# EasyEDA Pro project velocity_keyboard_board.eprj

# Schematic Schematic1
Board Name: Board1; Create Date: 2026-10-10; Page Name: P1; Project Name: DDswitch; Schematic Name: Schematic1; Update Date: 2026-10-10; Company: 嘉立创EDA; Page Size: A4; Version: V1.0
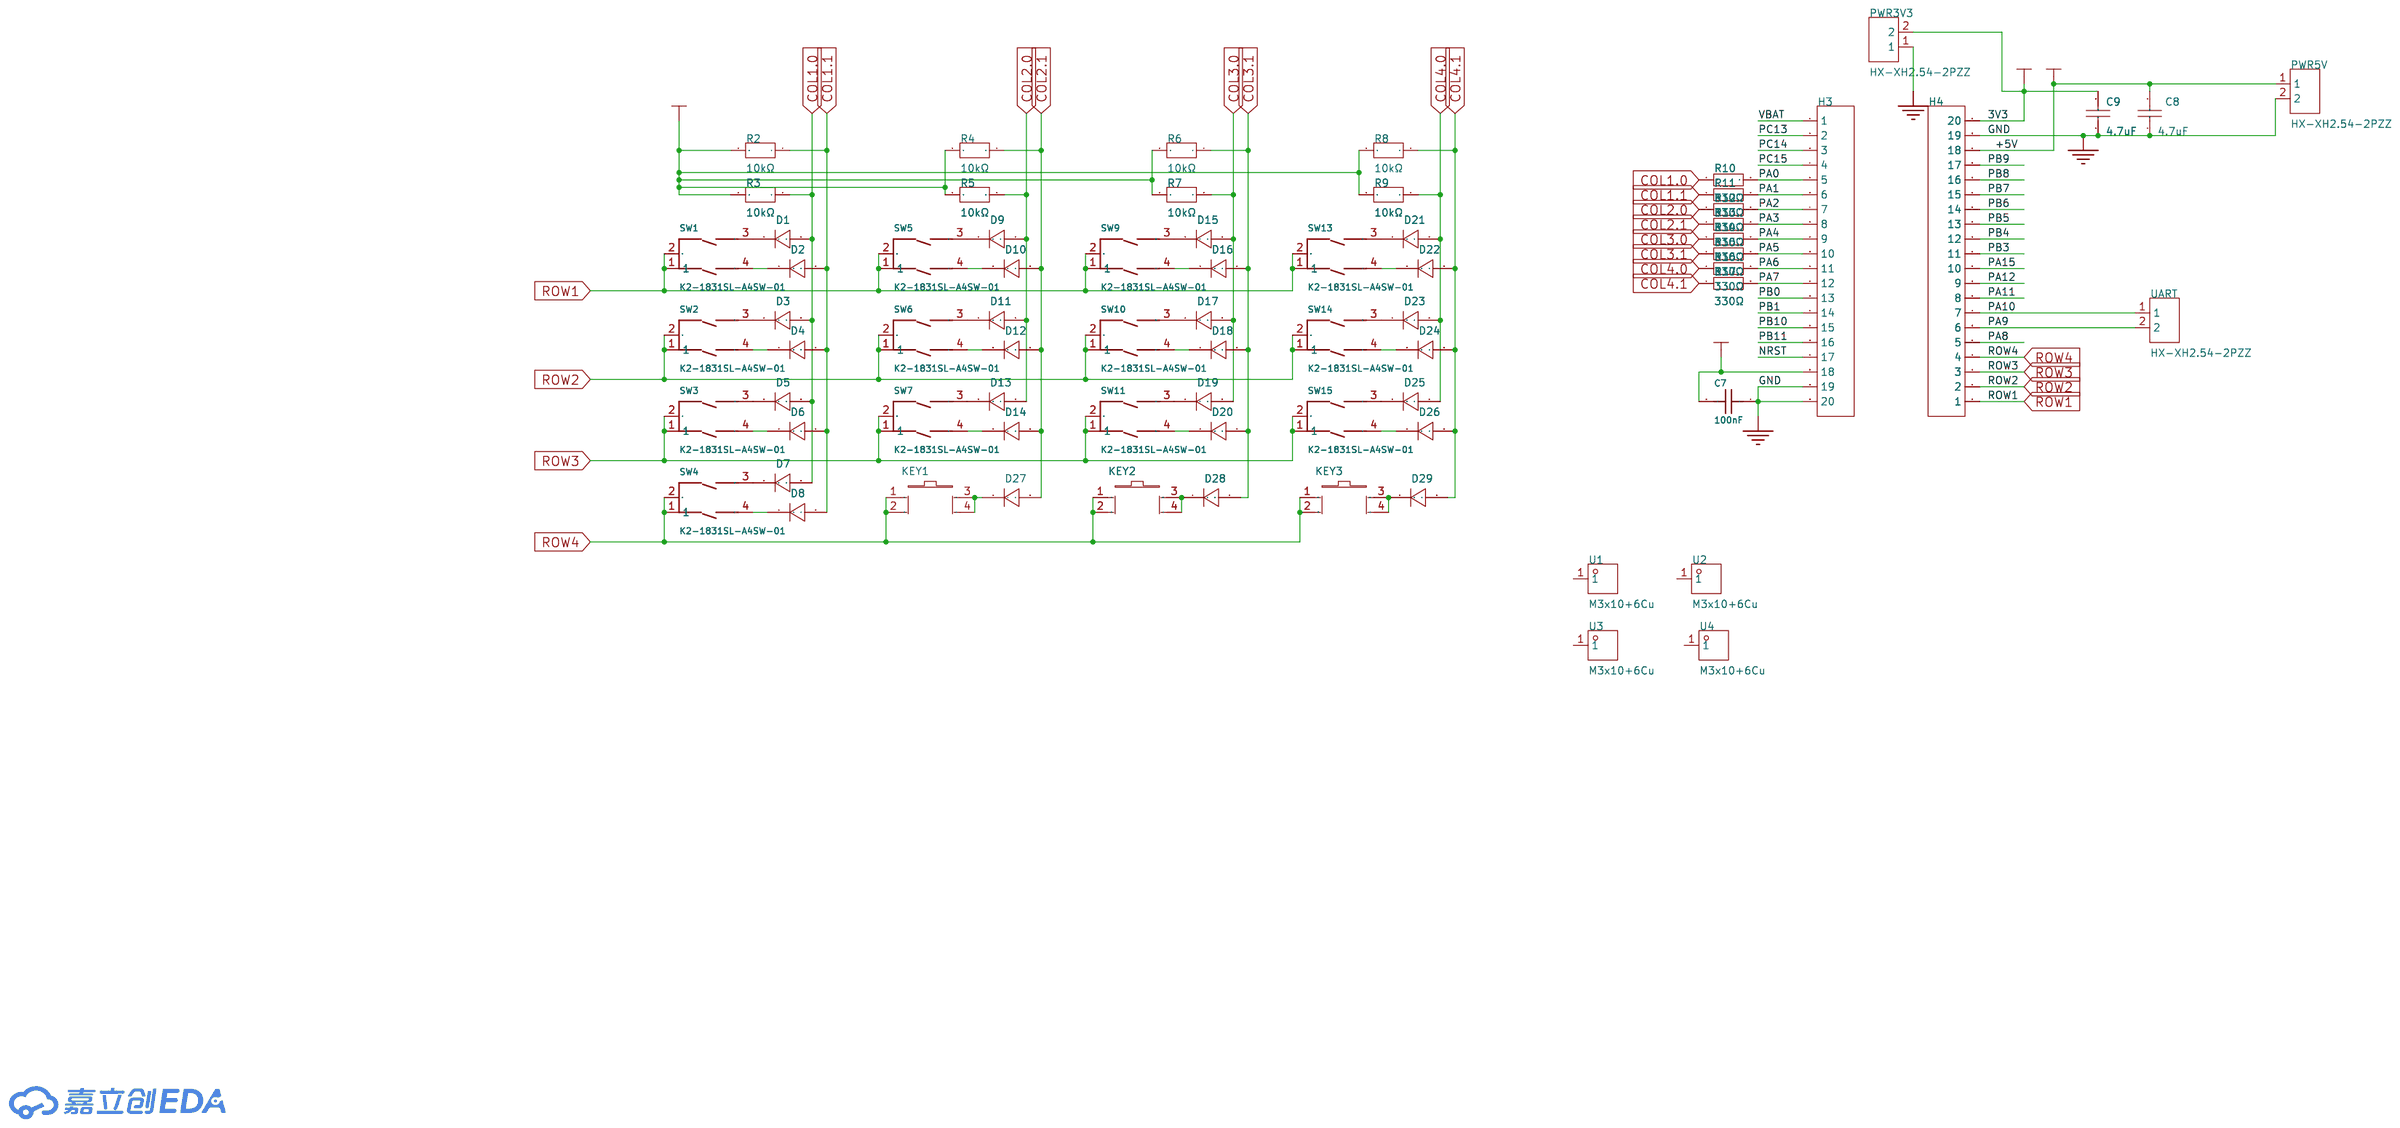
[diagram p0: schematic sheet]

## Parts
C7  100nF  [C0603]
C8  4.7uF  [C0805]
C9  4.7uF  [C0805]
D1  1N4148W  [SOD-123F_L2.7-W1.6-LS3.8-RD]
D2  1N4148W  [SOD-123F_L2.7-W1.6-LS3.8-RD]
D3  1N4148W  [SOD-123F_L2.7-W1.6-LS3.8-RD]
D4  1N4148W  [SOD-123F_L2.7-W1.6-LS3.8-RD]
D5  1N4148W  [SOD-123F_L2.7-W1.6-LS3.8-RD]
D6  1N4148W  [SOD-123F_L2.7-W1.6-LS3.8-RD]
D7  1N4148W  [SOD-123F_L2.7-W1.6-LS3.8-RD]
D8  1N4148W  [SOD-123F_L2.7-W1.6-LS3.8-RD]
D9  1N4148W  [SOD-123F_L2.7-W1.6-LS3.8-RD]
D10  1N4148W  [SOD-123F_L2.7-W1.6-LS3.8-RD]
D11  1N4148W  [SOD-123F_L2.7-W1.6-LS3.8-RD]
D12  1N4148W  [SOD-123F_L2.7-W1.6-LS3.8-RD]
D13  1N4148W  [SOD-123F_L2.7-W1.6-LS3.8-RD]
D14  1N4148W  [SOD-123F_L2.7-W1.6-LS3.8-RD]
D15  1N4148W  [SOD-123F_L2.7-W1.6-LS3.8-RD]
D16  1N4148W  [SOD-123F_L2.7-W1.6-LS3.8-RD]
D17  1N4148W  [SOD-123F_L2.7-W1.6-LS3.8-RD]
D18  1N4148W  [SOD-123F_L2.7-W1.6-LS3.8-RD]
D19  1N4148W  [SOD-123F_L2.7-W1.6-LS3.8-RD]
D20  1N4148W  [SOD-123F_L2.7-W1.6-LS3.8-RD]
D21  1N4148W  [SOD-123F_L2.7-W1.6-LS3.8-RD]
D22  1N4148W  [SOD-123F_L2.7-W1.6-LS3.8-RD]
D23  1N4148W  [SOD-123F_L2.7-W1.6-LS3.8-RD]
D24  1N4148W  [SOD-123F_L2.7-W1.6-LS3.8-RD]
D25  1N4148W  [SOD-123F_L2.7-W1.6-LS3.8-RD]
D26  1N4148W  [SOD-123F_L2.7-W1.6-LS3.8-RD]
D27  1N4148W  [SOD-123F_L2.7-W1.6-LS3.8-RD]
D28  1N4148W  [SOD-123F_L2.7-W1.6-LS3.8-RD]
D29  1N4148W  [SOD-123F_L2.7-W1.6-LS3.8-RD]
H3  -  [HDR-TH_20P-P2.54-V-F]
H4  -  [HDR-TH_20P-P2.54-V-F]
KEY1  轻触开关12x12x9直插  [KEY-TH_4P-L12.0-W12.0-P5.00-LS12.5]
KEY2  轻触开关12x12x9直插  [KEY-TH_4P-L12.0-W12.0-P5.00-LS12.5]
KEY3  轻触开关12x12x9直插  [KEY-TH_4P-L12.0-W12.0-P5.00-LS12.5]
PWR3V3  HX-XH2.54-2PZZ  [CONN-TH_2P-P2.50_HX-2.54MM-2P-ZZ-MS]
PWR5V  HX-XH2.54-2PZZ  [CONN-TH_2P-P2.50_HX-2.54MM-2P-ZZ-MS]
R2  10kΩ  [R0805]
R3  10kΩ  [R0805]
R4  10kΩ  [R0805]
R5  10kΩ  [R0805]
R6  10kΩ  [R0805]
R7  10kΩ  [R0805]
R8  10kΩ  [R0805]
R9  10kΩ  [R0805]
R10  330Ω  [R0805]
R11  330Ω  [R0805]
R12  330Ω  [R0805]
R13  330Ω  [R0805]
R14  330Ω  [R0805]
R15  330Ω  [R0805]
R16  330Ω  [R0805]
R17  330Ω  [R0805]
SW1  K2-1831SL-A4SW-01  [SW-SMD_4P-L6.5-W6.2-P4.50-LS8.4-TL-EH]
SW2  K2-1831SL-A4SW-01  [SW-SMD_4P-L6.5-W6.2-P4.50-LS8.4-TL-EH]
SW3  K2-1831SL-A4SW-01  [SW-SMD_4P-L6.5-W6.2-P4.50-LS8.4-TL-EH]
SW4  K2-1831SL-A4SW-01  [SW-SMD_4P-L6.5-W6.2-P4.50-LS8.4-TL-EH]
SW5  K2-1831SL-A4SW-01  [SW-SMD_4P-L6.5-W6.2-P4.50-LS8.4-TL-EH]
SW6  K2-1831SL-A4SW-01  [SW-SMD_4P-L6.5-W6.2-P4.50-LS8.4-TL-EH]
SW7  K2-1831SL-A4SW-01  [SW-SMD_4P-L6.5-W6.2-P4.50-LS8.4-TL-EH]
SW9  K2-1831SL-A4SW-01  [SW-SMD_4P-L6.5-W6.2-P4.50-LS8.4-TL-EH]
SW10  K2-1831SL-A4SW-01  [SW-SMD_4P-L6.5-W6.2-P4.50-LS8.4-TL-EH]
SW11  K2-1831SL-A4SW-01  [SW-SMD_4P-L6.5-W6.2-P4.50-LS8.4-TL-EH]
SW13  K2-1831SL-A4SW-01  [SW-SMD_4P-L6.5-W6.2-P4.50-LS8.4-TL-EH]
SW14  K2-1831SL-A4SW-01  [SW-SMD_4P-L6.5-W6.2-P4.50-LS8.4-TL-EH]
SW15  K2-1831SL-A4SW-01  [SW-SMD_4P-L6.5-W6.2-P4.50-LS8.4-TL-EH]
U1  M3x10+6Cu  [SMD_L4.7-W4.7-D3.0]
U2  M3x10+6Cu  [SMD_L4.7-W4.7-D3.0]
U3  M3x10+6Cu  [SMD_L4.7-W4.7-D3.0]
U4  M3x10+6Cu  [SMD_L4.7-W4.7-D3.0]
UART  HX-XH2.54-2PZZ  [CONN-TH_2P-P2.50_HX-2.54MM-2P-ZZ-MS]

## Library data of the parts
C7 = CC0603KRX7R9BB104: 容值:100nF;精度:±10%;额定电压:50V;温度系数:X7R;; LCSC Part Name: 100nF ±10% 50V; Supplier Part: C14663; Manufacturer: YAGEO(国巨); Supplier Footprint: 0603; JLCPCB Part Class: 基础库; Datasheet: https://item.szlcsc.com/datasheet/CC0603KRX7R9BB104/15331.html; Supplier: LCSC; Tolerance: ±10%; Voltage Rating: 50V; Temperature Coefficient: X7R
C8 C9 = CL21A475KAQNNNE: 容值:4.7uF;精度:±10%;额定电压:25V;温度系数:X5R;; LCSC Part Name: 4.7uF ±10% 25V; Supplier Part: C1779; Manufacturer: SAMSUNG(三星); Supplier Footprint: 0805; JLCPCB Part Class: 基础库; Datasheet: https://item.szlcsc.com/datasheet/CL21A475KAQNNNE/2131.html; Supplier: LCSC; Tolerance: ±10%; Voltage Rating: 25V; Temperature Coefficient: X5R
D1-D29 = 1N4148W_C81598: 二极管配置:独立式;整流电流:150mA;直流反向耐压(Vr):75V;正向压降(Vf):1V@50mA;反向恢复时间(Trr):4ns;; LCSC Part Name: 75V 150mA; Supplier Part: C81598; Manufacturer: ST(先科); Supplier Footprint: SOD-123; JLCPCB Part Class: 基础库; Datasheet: https://item.szlcsc.com/datasheet/1N4148W/82750.html; Supplier: LCSC; Diode Configuration: 独立式; Pd - Power Dissipation: 400mW; Current - Rectified: 150mA; Voltage - DC Reverse(Vr): 75V; Voltage - Forward(Vf@If): 1V@50mA; Non-Repetitive Peak Forward Surge Current: 1A; Reverse Leakage Current (Ir): 1uA@75V; Reverse Recovery Time (trr): 4ns
H3 H4 = HDR-F_2.54_1x20P: Supplier Part: C50984; Supplier Footprint: 插件; JLCPCB Part Class: 扩展库
KEY1-KEY3 = 轻触开关12x12x9直插: 塑料头; LCSC Part Name: 12x12x9; Supplier Part: C27371; Supplier Footprint: 插件; JLCPCB Part Class: 扩展库; Supplier: LCSC
PWR3V3 PWR5V UART = HX-XH2.54-2PZZ: 插针结构:1x2P;间距:2.54mm;安装方式:直插;参考系列:XH;总PIN数:2P;排数:1;每排PIN数:2;行距:-;额定电流:3A;触头材质:黄铜;触头镀层:锡;工作温度:-25℃~+85℃;; LCSC Part Name: 1x2P 间距:2.54mm 直插 系列:XH; Supplier Part: C42391660; Manufacturer: hanxia(韩下); Supplier Footprint: 插件,P=2.54mm; JLCPCB Part Class: 扩展库; Datasheet: https://item.szlcsc.com/datasheet/HX-XH2.54-2PZZ/44326932.html; Supplier: LCSC; Pins Structure: 1x2P; Pitch: 2.54mm; Mounting Type: 直插; Reference Series: XH; Number of Pins: 2P; Number of Rows: 1; Number of PINs Per Row: 2; Current Rating: 3A; Contact Material: 黄铜; Contact Plating: 锡; Operating Temperature: -25℃~+85℃; Voltage Rating: 250V; Plastic Material: PA66; Flame Retardant Rating: UL94V-0; Color: 白色
R2-R9 = FRC0805F1002TS: LCSC Part Name: 10kΩ ±1% 125mW 厚膜电阻; Supplier Part: C2907219; Manufacturer: FOJAN(富捷); Supplier Footprint: 0805; JLCPCB Part Class: 扩展库; Supplier: LCSC; Type: 厚膜电阻; Tolerance: ±1%; Power(Watts): 125mW; Voltage-Supply(Max): 150V; Temperature Coefficient: ±100ppm/℃; Operating Temperature: -55℃~+155℃
R10-R17 = 0805W8F3300T5E: LCSC Part Name: 厚膜电阻 330Ω ±1%; Supplier Part: C17630; Manufacturer: UNI-ROYAL(厚声); Supplier Footprint: 0805; JLCPCB Part Class: 基础库; Datasheet: https://item.szlcsc.com/datasheet/0805W8F3300T5E/18318.html; Supplier: LCSC; Type: 厚膜电阻; Tolerance: ±1%; Power(Watts): 125mW; Voltage-Supply(Max): 150V; Temperature Coefficient: ±100ppm/℃; Operating Temperature: -55℃~+155℃
SW1-SW7 SW9-SW11 SW13-SW15 = K2-1831SL-A4SW-01: LCSC Part Name: 6.2mm×6.5mm 两段式 4P贴片轻触开关; Supplier Part: C38535756; Manufacturer: 韩国韩荣; Supplier Footprint: SMD-4P,6.5x6.2mm; JLCPCB Part Class: 扩展库; Datasheet: https://item.szlcsc.com/datasheet/K2-1831SL-A4SW-01/40261745.html; Supplier: LCSC
U1-U4 = M3x10+6Cu: M3x10+6; LCSC Part Name: Shuntian(顺天五金) 单头六角隔离铜柱螺柱 M3X10+6 国标 黄铜 袋装; Supplier Part: C551322; Manufacturer: Shuntian(顺天五金); JLCPCB Part Class: 扩展库; Datasheet: https://item.szlcsc.com/datasheet/M3x10%252B6Cu/575012.html; Supplier: LCSC

## Nets
3V3: C7.2 C9.2 H3.18 H4.20 PWR3V3.2 R2.2 R3.2 R4.2 R5.2 R6.2 R7.2 R8.2 R9.2
+5V: C8.2 H4.18 PWR5V.1
GND: C7.1 C8.1 C9.1 H3.19 H3.20 H4.19 PWR3V3.1 PWR5V.2
VBAT: H3.1
COL1.0: D1.2(A) D3.2(A) D5.2(A) D7.2(A) R3.1 R10.1
COL1.1: D2.2(A) D4.2(A) D6.2(A) D8.2(A) R2.1 R11.1
COL2.0: D9.2(A) D11.2(A) D13.2(A) R5.1 R12.1
COL2.1: D10.2(A) D12.2(A) D14.2(A) D27.2(A) R4.1 R13.1
COL3.0: D15.2(A) D17.2(A) D19.2(A) R7.1 R14.1
COL3.1: D16.2(A) D18.2(A) D20.2(A) D28.2(A) R6.1 R15.1
COL4.0: D21.2(A) D23.2(A) D25.2(A) R9.1 R16.1
COL4.1: D22.2(A) D24.2(A) D26.2(A) D29.2(A) R8.1 R17.1
NRST: H3.17
PA0: H3.5 R10.2
PA1: H3.6 R11.2
PA2: H3.7 R12.2
PA3: H3.8 R13.2
PA4: H3.9 R14.2
PA5: H3.10 R15.2
PA6: H3.11 R16.2
PA7: H3.12 R17.2
PA8: H4.5
PA9: H4.6 UART.2
PA10: H4.7 UART.1
PA11: H4.8
PA12: H4.9
PA15: H4.10
PB0: H3.13
PB1: H3.14
PB3: H4.11
PB4: H4.12
PB5: H4.13
PB6: H4.14
PB7: H4.15
PB8: H4.16
PB9: H4.17
PB10: H3.15
PB11: H3.16
PC13: H3.2
PC14: H3.3
PC15: H3.4
ROW1: H4.1 SW1.1 SW1.2(C) SW5.1 SW5.2(C) SW9.1 SW9.2(C) SW13.1 SW13.2(C)
ROW2: H4.2 SW2.1 SW2.2(C) SW6.1 SW6.2(C) SW10.1 SW10.2(C) SW14.1 SW14.2(C)
ROW3: H4.3 SW3.1 SW3.2(C) SW7.1 SW7.2(C) SW11.1 SW11.2(C) SW15.1 SW15.2(C)
ROW4: H4.4 KEY1.1 KEY1.2 KEY2.1 KEY2.2 KEY3.1 KEY3.2 SW4.1 SW4.2(C)
$1N820: D2.1(K) SW1.4
$1N986: D6.1(K) SW3.4
$1N1068: D8.1(K) SW4.4
$1N1150: D10.1(K) SW5.4
$1N1314: D14.1(K) SW7.4
$1N1396: D16.1(K) SW9.4
$1N1560: D20.1(K) SW11.4
$1N1642: D22.1(K) SW13.4
$1N1724: D24.1(K) SW14.4
$1N1806: D26.1(K) SW15.4
$1N1847: D27.1(K) KEY1.3 KEY1.4
$1N1888: D28.1(K) KEY2.3 KEY2.4
$1N2696: D1.1(K) SW1.3
$1N2698: D9.1(K) SW5.3
$1N2700: D15.1(K) SW9.3
$1N2702: D21.1(K) SW13.3
$1N2704: D23.1(K) SW14.3
$1N2706: D25.1(K) SW15.3
$1N2708: D19.1(K) SW11.3
$1N2710: D17.1(K) SW10.3
$1N2712: D11.1(K) SW6.3
$1N2718: D13.1(K) SW7.3
$1N2720: D5.1(K) SW3.3
$1N2722: D7.1(K) SW4.3
$1N2969: D3.1(K) SW2.3
$1N3135: D12.1(K) SW6.4
$1N3179: D4.1(K) SW2.4
$1N3328: D18.1(K) SW10.4
$1N6597: D29.1(K) KEY3.3 KEY3.4

Not connected (* = marked no-connect by the designer): U1 1; U2 1; U3 1; U4 1

# Board PCB1
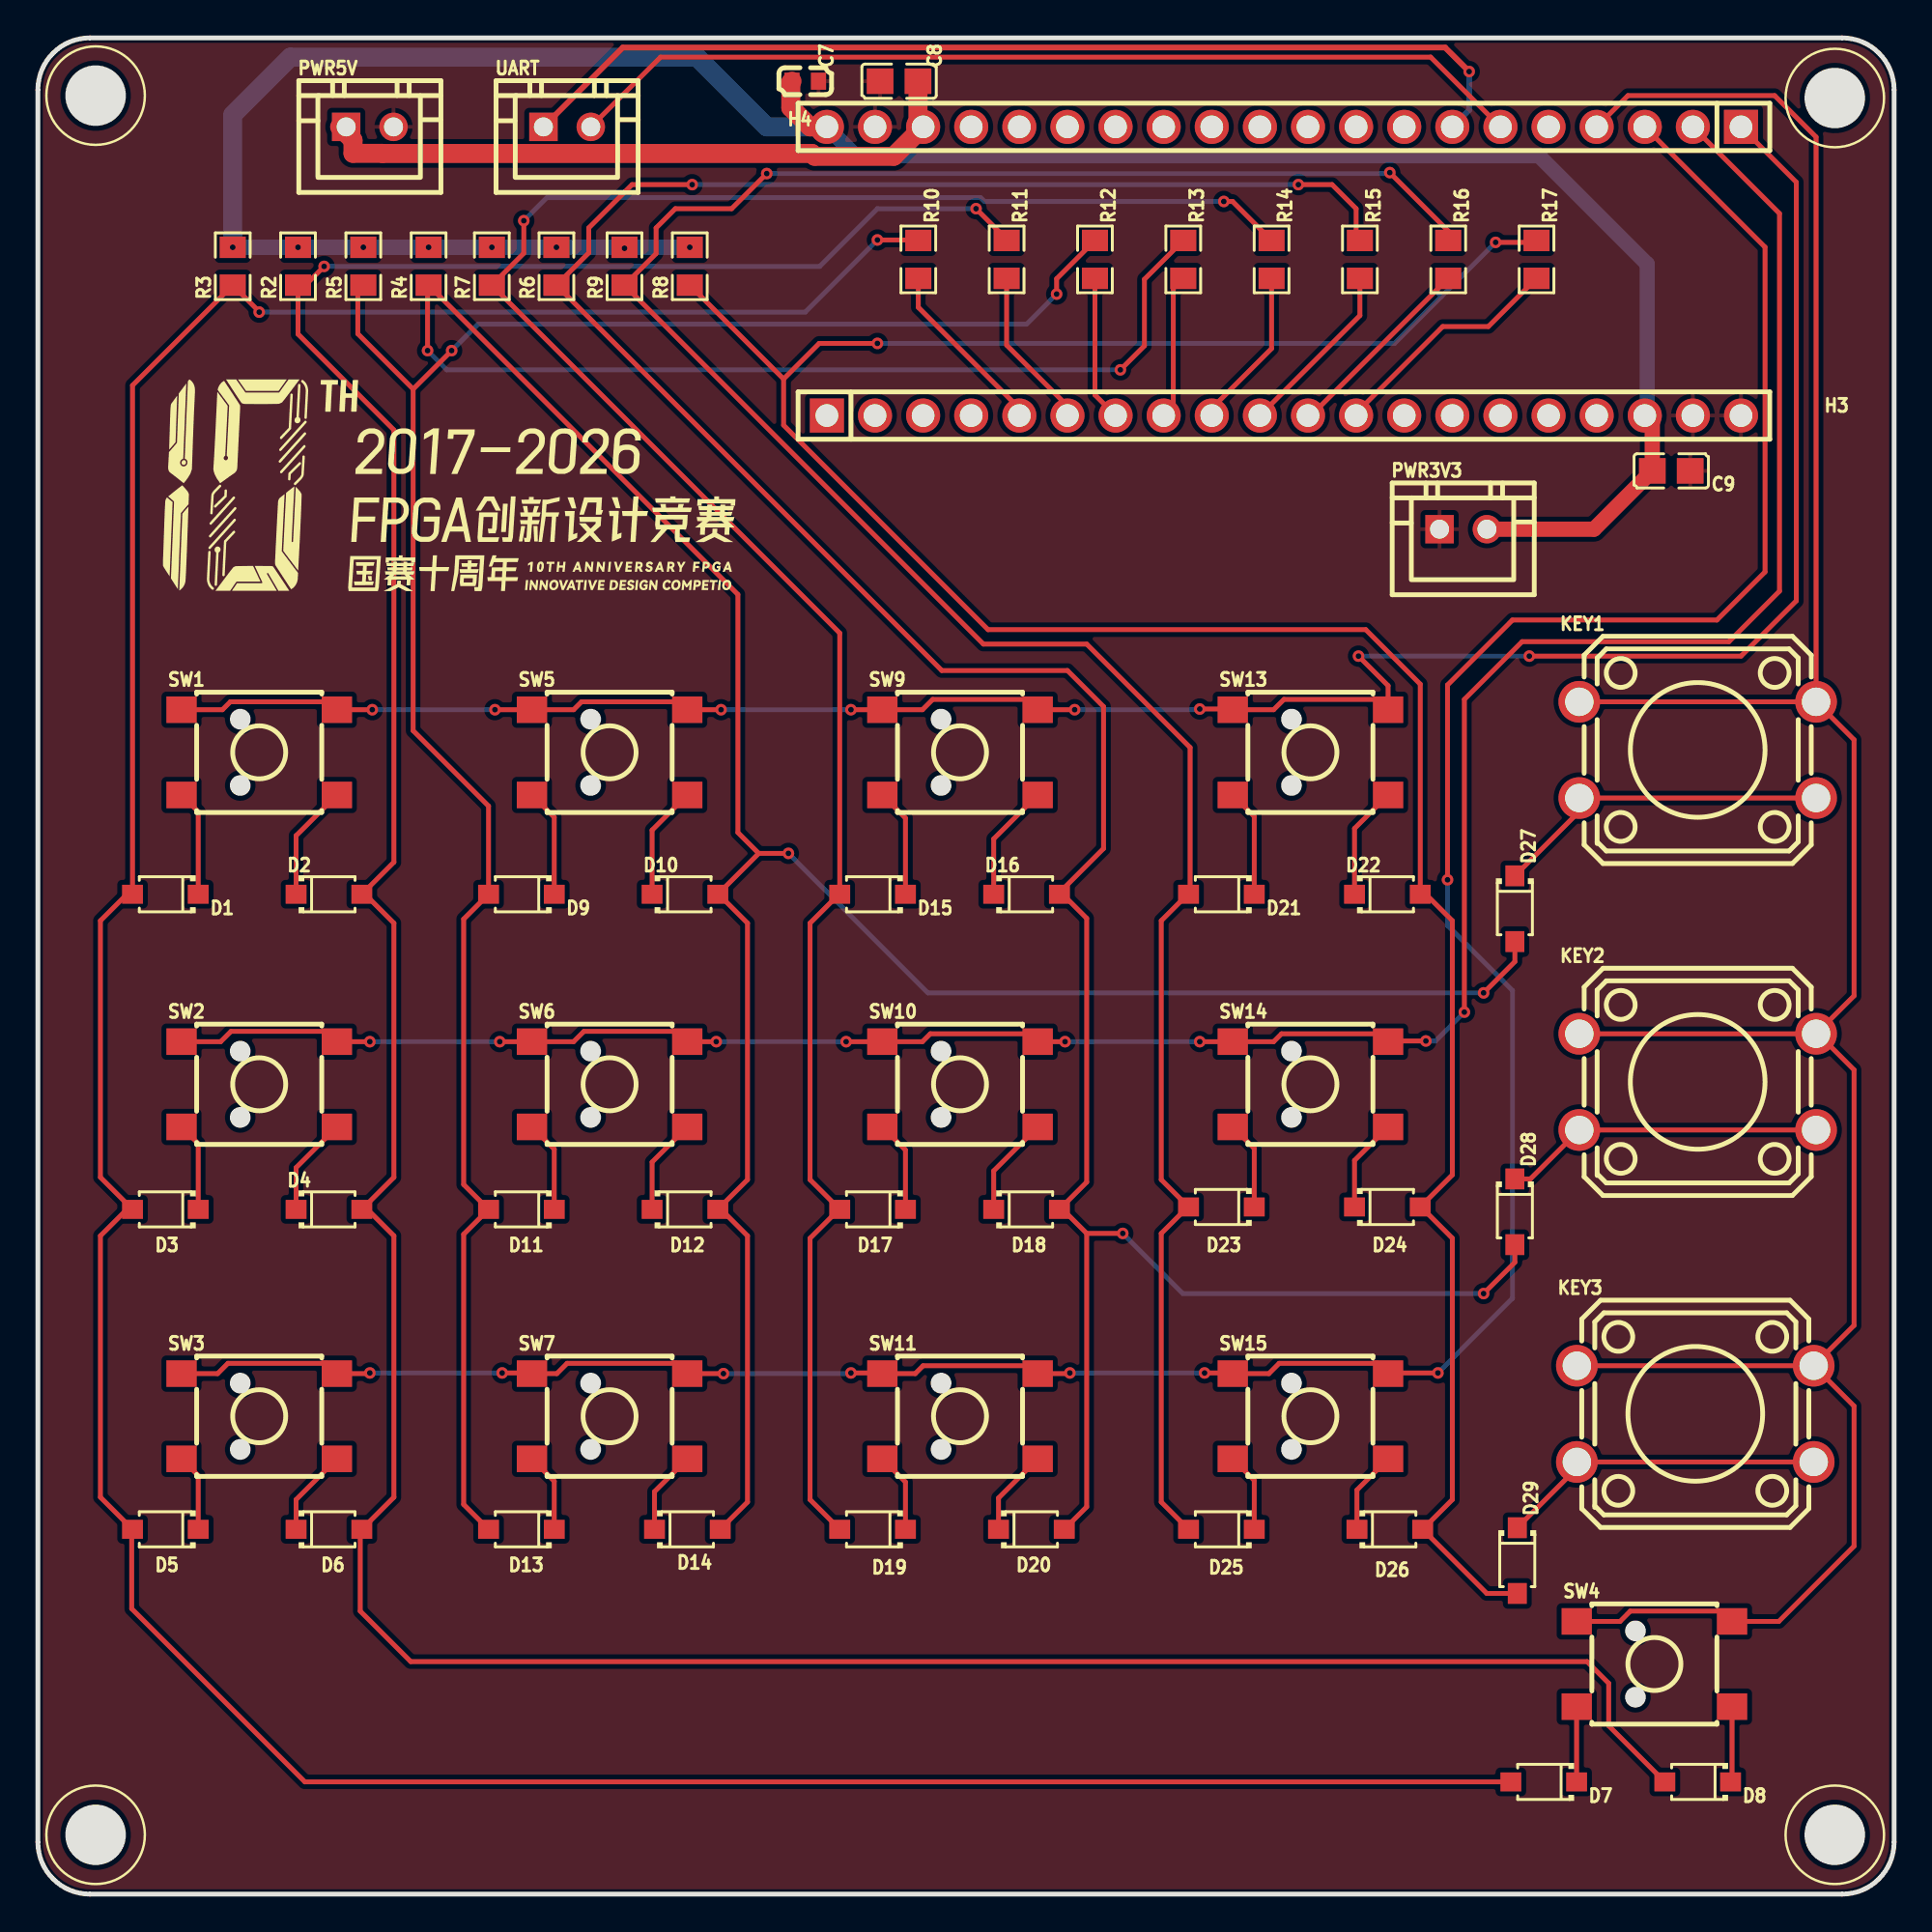
[diagram p1: board, top side]
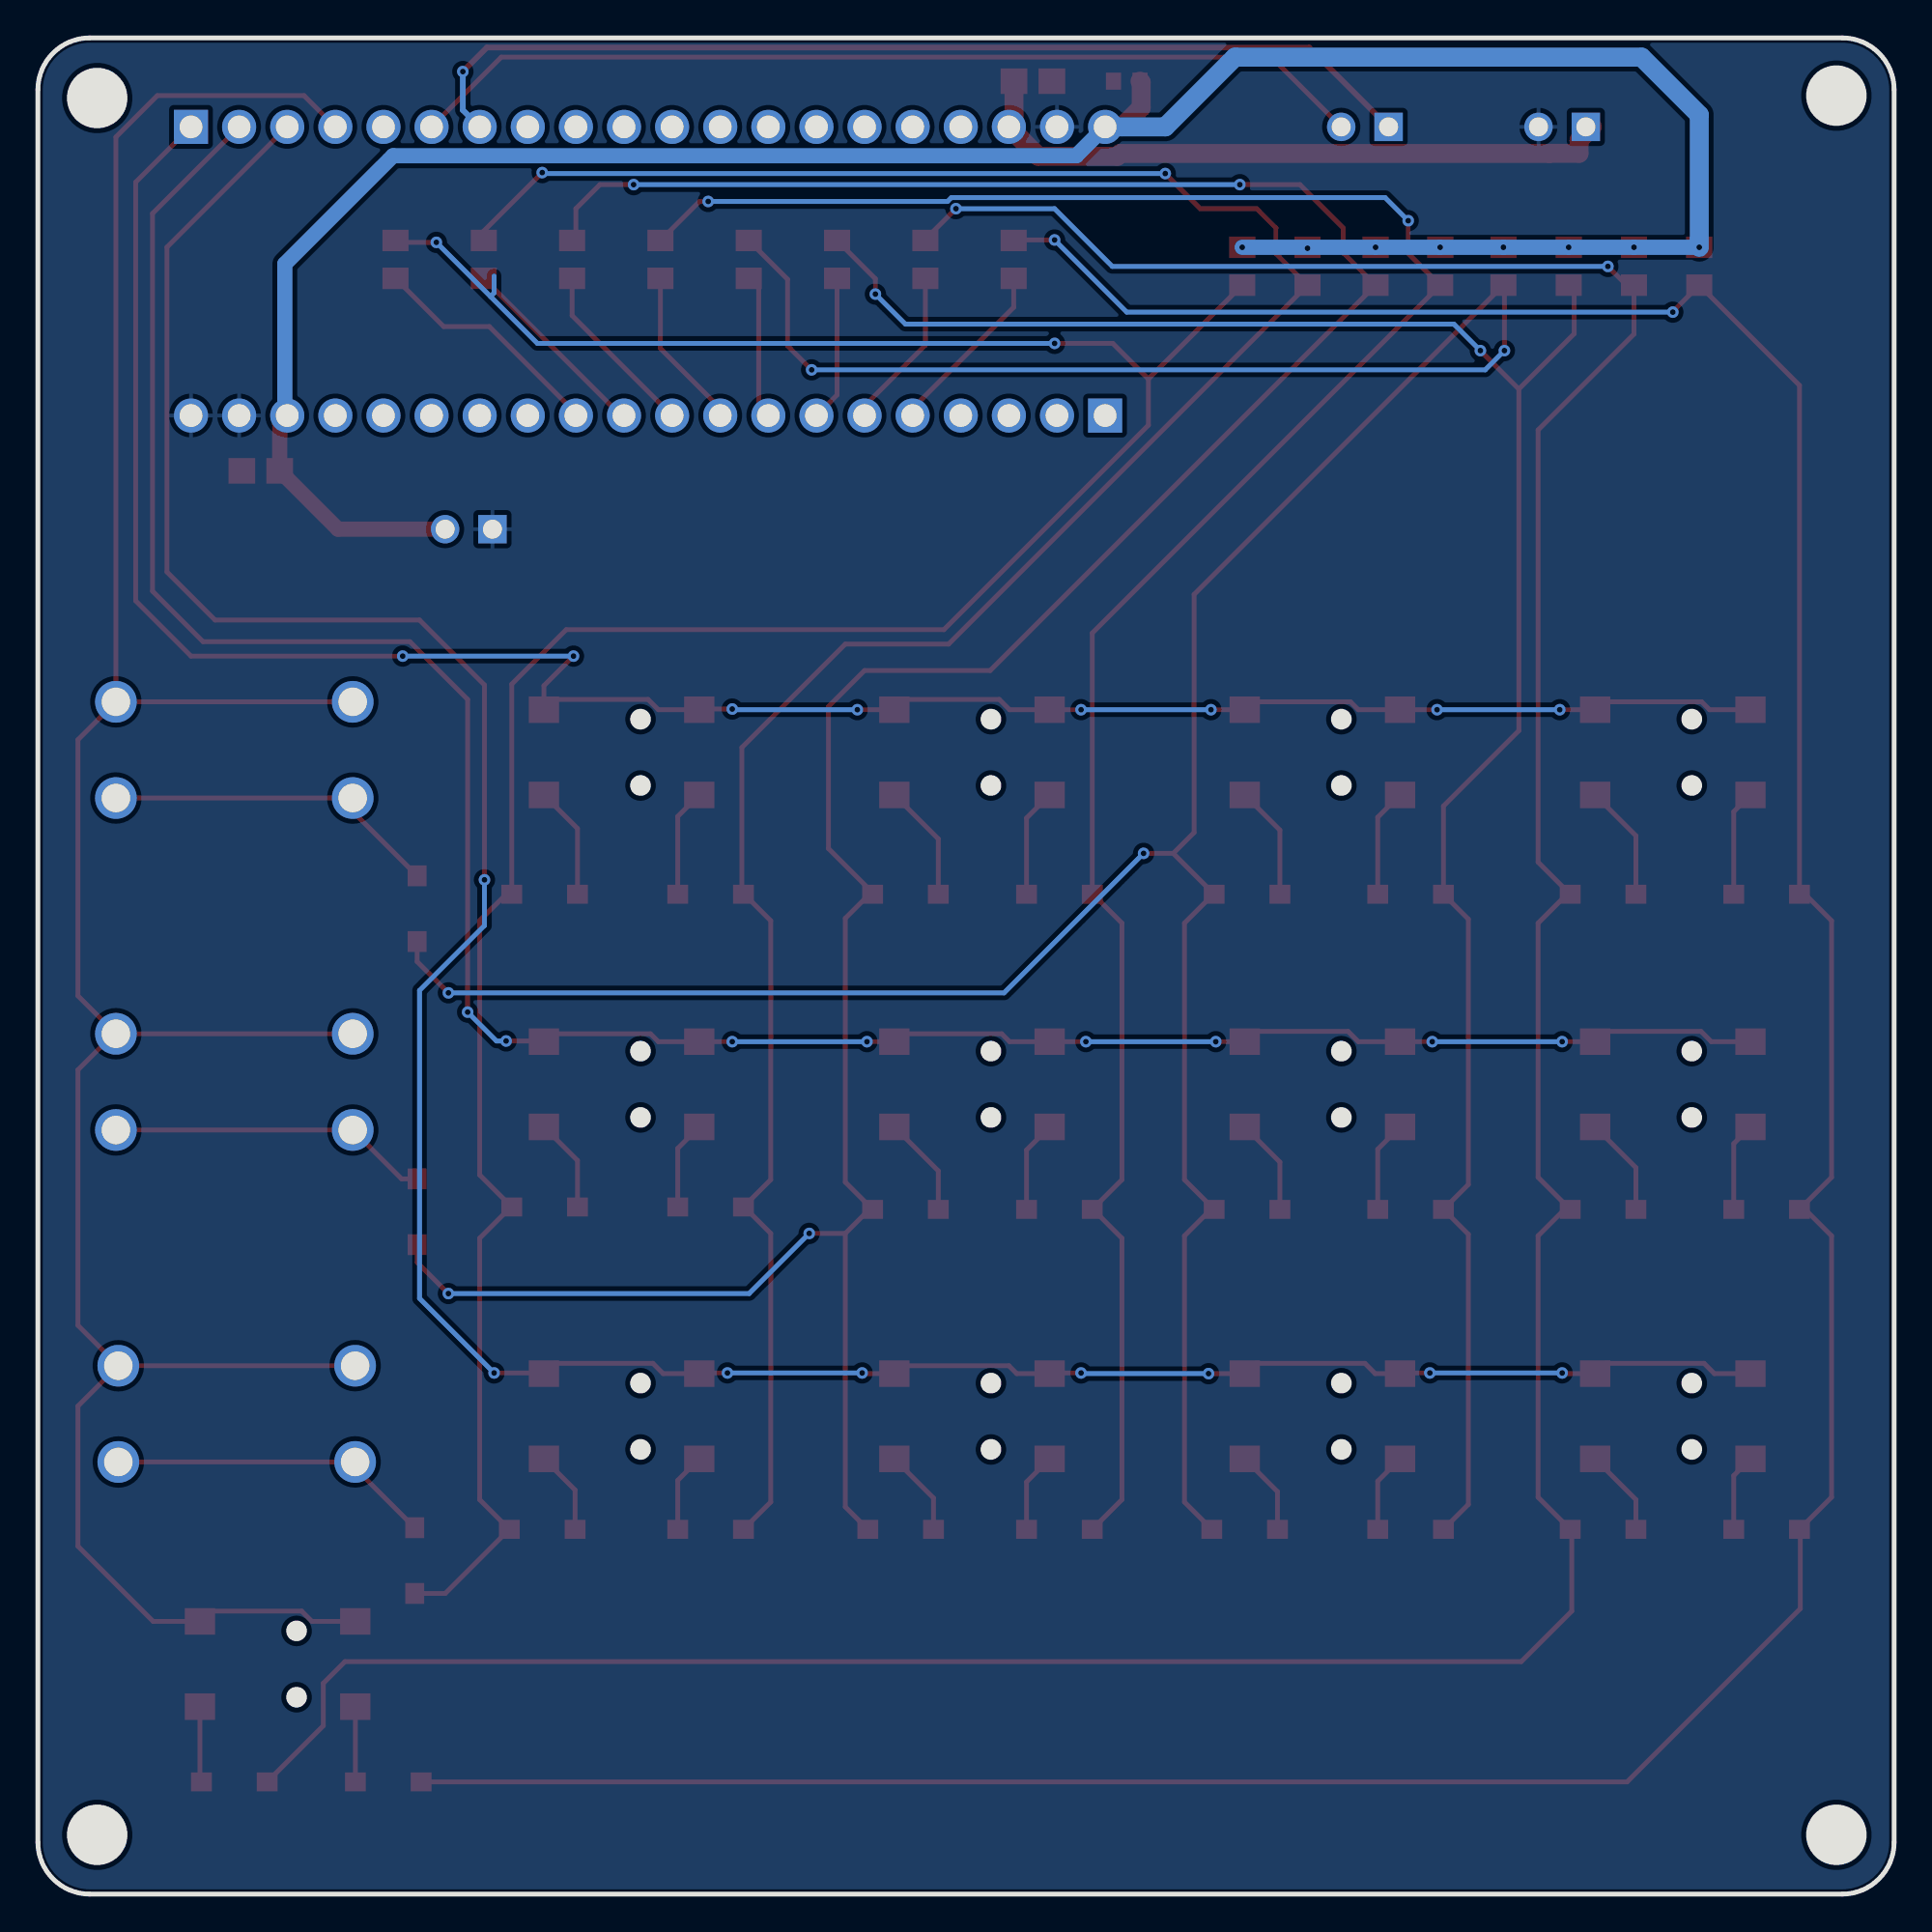
[diagram p2: board, bottom side, seen from below]

Outline 98 x 98 mm; copper layers: Top Layer, Bottom Layer. Coordinates in mm from the lower left corner of the outline.
Outline path: 0,95.26 0,2.74 arc(0.8,0.8) 2.74,0 95.26,0 arc(97.2,0.8) 98,2.74 98,95.26 arc(97.2,97.2) 95.26,98 2.74,98 arc(0.8,97.2) 0,95.26
Stack: Top Layer 0.035mm / Dielectric1 1.51mm FR4 er 4.5 / Bottom Layer 0.035mm

## Design rules (mm)
template: JLCPCB Capability(Two Layers Board)
spacing copperThickness1oz (default): track to track 0.102, other pairs 0.152 to 0.3
spacing copperThickness2oz: track to track 0.203, other pairs 0.152 to 0.3
track width copperThickness1oz (default): min 0.127, default 0.254, max 2.54
track width copperThickness2oz: min 0.203, default 0.254, max 2.54
differential pair differentialPair (default): width min 0.127, default 0.254, max 2.54; gap min 0.152, default 0.152
via viaSize (default): diameter min 0.5, default 0.61, max 10; hole min 0.3, default 0.305, max 6.3

## Placement (name value [footprint] x y rotation side)
C7  100nF  [C0603]  40.51 95.71 180 top
C8  4.7uF  [C0805]  45.47 95.71 0 top
C9  4.7uF  [C0805]  86.23 75.14 180 top
D1  1N4148W  [SOD-123F_L2.7-W1.6-LS3.8-RD]  6.73 52.79 180 top
D2  1N4148W  [SOD-123F_L2.7-W1.6-LS3.8-RD]  15.37 52.79 0 top
D3  1N4148W  [SOD-123F_L2.7-W1.6-LS3.8-RD]  6.73 36.15 180 top
D4  1N4148W  [SOD-123F_L2.7-W1.6-LS3.8-RD]  15.37 36.15 0 top
D5  1N4148W  [SOD-123F_L2.7-W1.6-LS3.8-RD]  6.73 19.26 180 top
D6  1N4148W  [SOD-123F_L2.7-W1.6-LS3.8-RD]  15.37 19.26 0 top
D7  1N4148W  [SOD-123F_L2.7-W1.6-LS3.8-RD]  79.5 5.93 180 top
D8  1N4148W  [SOD-123F_L2.7-W1.6-LS3.8-RD]  87.63 5.93 180 top
D9  1N4148W  [SOD-123F_L2.7-W1.6-LS3.8-RD]  25.53 52.79 180 top
D10  1N4148W  [SOD-123F_L2.7-W1.6-LS3.8-RD]  34.16 52.79 0 top
D11  1N4148W  [SOD-123F_L2.7-W1.6-LS3.8-RD]  25.53 36.15 180 top
D12  1N4148W  [SOD-123F_L2.7-W1.6-LS3.8-RD]  34.16 36.15 0 top
D13  1N4148W  [SOD-123F_L2.7-W1.6-LS3.8-RD]  25.53 19.26 180 top
D14  1N4148W  [SOD-123F_L2.7-W1.6-LS3.8-RD]  34.29 19.26 0 top
D15  1N4148W  [SOD-123F_L2.7-W1.6-LS3.8-RD]  44.07 52.79 180 top
D16  1N4148W  [SOD-123F_L2.7-W1.6-LS3.8-RD]  52.2 52.79 0 top
D17  1N4148W  [SOD-123F_L2.7-W1.6-LS3.8-RD]  44.07 36.15 180 top
D18  1N4148W  [SOD-123F_L2.7-W1.6-LS3.8-RD]  52.2 36.15 0 top
D19  1N4148W  [SOD-123F_L2.7-W1.6-LS3.8-RD]  44.07 19.26 180 top
D20  1N4148W  [SOD-123F_L2.7-W1.6-LS3.8-RD]  52.45 19.26 0 top
D21  1N4148W  [SOD-123F_L2.7-W1.6-LS3.8-RD]  62.48 52.79 180 top
D22  1N4148W  [SOD-123F_L2.7-W1.6-LS3.8-RD]  71.25 52.79 0 top
D23  1N4148W  [SOD-123F_L2.7-W1.6-LS3.8-RD]  62.48 36.28 180 top
D24  1N4148W  [SOD-123F_L2.7-W1.6-LS3.8-RD]  71.25 36.28 0 top
D25  1N4148W  [SOD-123F_L2.7-W1.6-LS3.8-RD]  62.48 19.26 180 top
D26  1N4148W  [SOD-123F_L2.7-W1.6-LS3.8-RD]  71.37 19.26 0 top
D27  1N4148W  [SOD-123F_L2.7-W1.6-LS3.8-RD]  77.98 52.03 270 top
D28  1N4148W  [SOD-123F_L2.7-W1.6-LS3.8-RD]  77.98 36.02 270 top
D29  1N4148W  [SOD-123F_L2.7-W1.6-LS3.8-RD]  78.11 17.61 270 top
H3  -  [HDR-TH_20P-P2.54-V-F]  65.79 78.06 0 top
H4  -  [HDR-TH_20P-P2.54-V-F]  65.79 93.3 180 top
KEY1  轻触开关12x12x9直插  [KEY-TH_4P-L12.0-W12.0-P5.00-LS12.5]  87.63 60.41 0 top
KEY2  轻触开关12x12x9直插  [KEY-TH_4P-L12.0-W12.0-P5.00-LS12.5]  87.63 42.88 0 top
KEY3  轻触开关12x12x9直插  [KEY-TH_4P-L12.0-W12.0-P5.00-LS12.5]  87.5 25.36 0 top
PWR3V3  HX-XH2.54-2PZZ  [CONN-TH_2P-P2.50_HX-2.54MM-2P-ZZ-MS]  75.25 72.06 0 top
PWR5V  HX-XH2.54-2PZZ  [CONN-TH_2P-P2.50_HX-2.54MM-2P-ZZ-MS]  17.53 93.3 0 top
R2  10kΩ  [R0805]  13.73 85.94 90 top
R3  10kΩ  [R0805]  10.29 85.94 90 top
R4  10kΩ  [R0805]  20.63 85.94 90 top
R5  10kΩ  [R0805]  17.18 85.94 90 top
R6  10kΩ  [R0805]  27.38 85.94 90 top
R7  10kΩ  [R0805]  23.97 85.94 90 top
R8  10kΩ  [R0805]  34.42 85.94 90 top
R9  10kΩ  [R0805]  30.97 85.94 90 top
R10  330Ω  [R0805]  46.48 86.3 270 top
R11  330Ω  [R0805]  51.14 86.3 270 top
R12  330Ω  [R0805]  55.81 86.3 270 top
R13  330Ω  [R0805]  60.47 86.3 270 top
R14  330Ω  [R0805]  65.13 86.3 270 top
R15  330Ω  [R0805]  69.8 86.3 270 top
R16  330Ω  [R0805]  74.46 86.3 270 top
R17  330Ω  [R0805]  79.12 86.3 270 top
SW1  K2-1831SL-A4SW-01  [SW-SMD_4P-L6.5-W6.2-P4.50-LS8.4-TL-EH]  11.68 60.28 0 top
SW2  K2-1831SL-A4SW-01  [SW-SMD_4P-L6.5-W6.2-P4.50-LS8.4-TL-EH]  11.68 42.75 0 top
SW3  K2-1831SL-A4SW-01  [SW-SMD_4P-L6.5-W6.2-P4.50-LS8.4-TL-EH]  11.68 25.23 0 top
SW4  K2-1831SL-A4SW-01  [SW-SMD_4P-L6.5-W6.2-P4.50-LS8.4-TL-EH]  85.34 12.15 0 top
SW5  K2-1831SL-A4SW-01  [SW-SMD_4P-L6.5-W6.2-P4.50-LS8.4-TL-EH]  30.18 60.28 0 top
SW6  K2-1831SL-A4SW-01  [SW-SMD_4P-L6.5-W6.2-P4.50-LS8.4-TL-EH]  30.18 42.75 0 top
SW7  K2-1831SL-A4SW-01  [SW-SMD_4P-L6.5-W6.2-P4.50-LS8.4-TL-EH]  30.18 25.23 0 top
SW9  K2-1831SL-A4SW-01  [SW-SMD_4P-L6.5-W6.2-P4.50-LS8.4-TL-EH]  48.68 60.28 0 top
SW10  K2-1831SL-A4SW-01  [SW-SMD_4P-L6.5-W6.2-P4.50-LS8.4-TL-EH]  48.68 42.75 0 top
SW11  K2-1831SL-A4SW-01  [SW-SMD_4P-L6.5-W6.2-P4.50-LS8.4-TL-EH]  48.68 25.23 0 top
SW13  K2-1831SL-A4SW-01  [SW-SMD_4P-L6.5-W6.2-P4.50-LS8.4-TL-EH]  67.18 60.28 0 top
SW14  K2-1831SL-A4SW-01  [SW-SMD_4P-L6.5-W6.2-P4.50-LS8.4-TL-EH]  67.18 42.75 0 top
SW15  K2-1831SL-A4SW-01  [SW-SMD_4P-L6.5-W6.2-P4.50-LS8.4-TL-EH]  67.18 25.23 0 top
U1  M3x10+6Cu  [SMD_L4.7-W4.7-D3.0]  3.05 94.95 0 top
U2  M3x10+6Cu  [SMD_L4.7-W4.7-D3.0]  3.05 3.13 0 top
U3  M3x10+6Cu  [SMD_L4.7-W4.7-D3.0]  94.87 94.82 0 top
U4  M3x10+6Cu  [SMD_L4.7-W4.7-D3.0]  94.87 3.13 0 top
UART  HX-XH2.54-2PZZ  [CONN-TH_2P-P2.50_HX-2.54MM-2P-ZZ-MS]  27.94 93.3 0 top

## Footprints (pads in the part's own frame, mm; a bottom-side part is the same pattern mirrored in y, then rotated)
C0603
  rect 0.8x0.9 smd: 1(-0.7,0) 2(0.7,0)
C0805
  rect 1.41x1.35 smd: 1(-1,0) 2(1,0)
CONN-TH_2P-P2.50_HX-2.54MM-2P-ZZ-MS
  rect 1.5x1.5 hole 1: 1(-1.25,0)
  round 1.5 hole 1: 2(1.25,0)
HDR-TH_20P-P2.54-V-F
  rect 1.8x1.8 hole 1.2: 1(-24.13,0)
  round 1.8 hole 1.2: 2(-21.59,0) 3(-19.05,0) 4(-16.51,0) 5(-13.97,0) 6(-11.43,0) 7(-8.89,0) 8(-6.35,0) 9(-3.81,0) 10(-1.27,0) 11(1.27,0) 12(3.81,0) 13(6.35,0) 14(8.89,0) 15(11.43,0) 16(13.97,0) 17(16.51,0) 18(19.05,0) 19(21.59,0) 20(24.13,0)
KEY-TH_4P-L12.0-W12.0-P5.00-LS12.5
  round 2.2 hole 1.5: 1(-6.251,2.54) 2(6.251,2.54) 3(-6.251,-2.54) 4(6.251,-2.54)
R0805
  rect 1.133x1.377 smd: 1(-1,0) 2(1,0)
SOD-123F_L2.7-W1.6-LS3.8-RD
  rect 1.1x1 smd: 1(-1.735,0) 2(1.735,0)
SW-SMD_4P-L6.5-W6.2-P4.50-LS8.4-TL-EH
  rect 1.6x1.4 smd: 1(-4.1,2.25) 2(4.1,2.25) 3(-4.1,-2.25) 4(4.1,-2.25)

## Nets
As in the schematic.

## Via types
v1: diameter 0.61, hole 0.305, Top Layer to Bottom Layer, 53 vias

## Routing (per net, layer and track width the routed paths; a pad name or vN(x,y) marks a point on that pad's centre or on a via; arc(x,y) is an arc through that point)
3V3: length 136.5
  Top Layer w0.8: H3.18 85.23,77.66 C9.2 82.16,72.06 PWR3V3.2
  Top Layer w1: C7.2 39.75,95.65 39.75,94.32 40.77,93.3 H4.20
  Bottom Layer w0.8: v1(34.42,86.94) v1(27.38,86.94) v1(23.97,86.94) v1(20.63,86.94) v1(17.18,86.94) v1(13.73,86.94) v1(10.29,86.94) ; H4.20 43.18,91.78 79.25,91.78 84.96,86.06 84.96,78.19 H3.18
  Bottom Layer w1: H4.20 38.48,93.3 34.8,96.98 13.34,96.98 10.29,93.94 v1(10.29,86.94)
  vias: v1(30.97,86.89)
+5V: length 35
  Top Layer w1: C8.2 46.47,93.57 H4.18 45.18,91.75 41.01,91.75 40.86,91.9 18.2,91.9 18.19,91.9 16.64,91.9 16.64,92.59 15.93,93.3
COL1.0: length 190.2
  Top Layer w0.254: R10.1 46.45,87.33 v1(44.32,87.33) ; D7.2 14.1,5.93 4.95,15.07 4.95,19.22 D5.2 3.3,20.95 3.3,34.75 4.7,36.15 D3.2 3.3,37.84 3.3,51.39 4.7,52.79 D1.2 5,79.65 R3.1 11.68,83.55 v1(11.68,83.52)
  Bottom Layer w0.254: v1(44.32,87.33) 40.51,83.52 v1(11.68,83.52)
COL1.1: length 189.7
  Top Layer w0.254: v1(49.53,88.98) 51.14,87.37 R11.1 ; D8.2 82.93,8.89 82.93,11.13 81.79,12.28 19.69,12.28 17.02,14.94 17.02,19.18 D6.2 18.8,20.95 18.8,34.75 17.4,36.15 D4.2 18.8,37.84 18.8,51.26 17.27,52.79 D2.2 18.8,54.48 18.8,77.3 13.73,82.36 R2.1 14.12,84.94 v1(15.11,85.94)
  Bottom Layer w0.254: v1(15.11,85.94) 41.28,85.94 44.32,88.98 v1(49.53,88.98)
COL2.0: length 110.6
  Top Layer w0.254: v1(53.78,84.47) 53.78,85.28 R12.1 ; 19.81,79.46 v1(21.84,81.49) ; 19.81,79.46 16.89,82.38 16.89,84.65 R5.1 ; 19.81,79.46 19.81,61.42 23.79,57.44 D9.2 22.48,51.47 22.48,37.46 D11.2 22.48,34.84 22.48,20.57 D13.2
  Bottom Layer w0.254: v1(53.78,84.47) 52.2,82.89 23.24,82.89 v1(21.84,81.49)
COL2.1: length 169.9
  Top Layer w0.254: 38.06,54.95 36.96,56.05 36.96,68.62 R4.1 20.57,84.89 v1(20.57,81.49) ; 38.06,54.95 D10.2 35.94,52.79 37.47,51.26 37.47,37.72 D12.2 36.07,36.15 37.47,34.75 37.47,20.7 D14.2 ; 38.06,54.95 v1(39.62,54.95) ; R13.1 58.42,85.25 58.42,81.74 v1(57.15,80.47) ; v1(76.33,47.58) 77.98,49.23 D27.2
  Bottom Layer w0.254: v1(57.15,80.47) 21.59,80.47 v1(20.57,81.49) ; v1(39.62,54.95) 46.99,47.58 v1(76.33,47.58)
COL3.0: length 121
  Top Layer w0.254: D19.2 40.77,20.83 40.77,34.63 42.29,36.15 D17.2 40.77,37.72 40.77,51.26 42.29,52.79 D15.2 42.33,66.58 R7.1 25.65,86.63 v1(25.65,88.35) ; v1(62.61,89.36) 63.07,89.36 R14.1
  Bottom Layer w0.254: v1(25.65,88.35) 26.87,89.57 49.77,89.57 49.97,89.36 v1(62.61,89.36)
COL3.1: length 158
  Top Layer w0.254: v1(34.54,90.25) 31.37,90.25 29.08,87.97 29.08,86.65 R6.1 47.72,64.6 54.36,64.6 56.26,62.69 56.26,55.2 53.93,52.87 D16.2 54.1,52.79 55.37,51.52 55.37,37.59 D18.2 54.1,36.15 55.37,34.88 ; R15.1 69.6,87.5 69.6,88.98 68.33,90.25 v1(66.55,90.25) ; D20.2 55.37,20.45 55.37,34.88 ; v1(57.28,34.88) 55.37,34.88 ; D28.2 77.98,33.36 v1(76.33,31.71)
  Bottom Layer w0.254: v1(34.54,90.25) v1(66.55,90.25) ; v1(76.33,31.71) 60.45,31.71 v1(57.28,34.88)
COL4.0: length 132.2
  Top Layer w0.254: R16.1 74.46,87.8 v1(71.37,90.89) ; v1(38.48,90.84) 36.63,88.98 33.66,88.98 32.64,87.97 32.64,86.61 R9.1 49.92,66 55.37,66 60.83,60.53 60.83,52.87 D21.2 60.71,52.79 59.31,51.39 59.31,37.72 D23.2 60.71,36.28 59.31,34.88 59.31,20.7 D25.2
  Bottom Layer w0.254: v1(71.37,90.89) 71.32,90.84 v1(38.48,90.84)
COL4.1: length 146.6
  Top Layer w0.254: 39.37,79.99 39.37,77.55 50.16,66.76 70.1,66.76 72.98,63.88 D22.2 73.28,52.79 74.68,51.39 74.68,37.97 D24.2 73.03,36.28 74.68,34.63 74.68,20.83 D26.2 76.5,15.87 D29.2 ; 39.37,79.99 41.25,81.87 v1(44.32,81.87) ; 39.37,79.99 R8.1 ; R17.1 79.02,87.2 v1(76.96,87.2)
  Bottom Layer w0.254: 74.1,84.35 71.63,81.87 v1(44.32,81.87) ; 74.1,84.35 v1(76.96,87.2) ; 74.1,84.35 73.91,84.54 73.91,85.43
PA0: length 9.5
  Top Layer w0.254: H3.5 51.82,78.44 46.48,83.78 R10.2
PA1: length 8.6
  Top Layer w0.254: R11.2 51.14,81.78 54.36,78.57 H3.6
PA2: length 7.7
  Top Layer w0.254: R12.2 55.81,79.15 H3.7
PA3: length 7.7
  Top Layer w0.254: R13.2 59.94,84.78 59.94,78.57 H3.8
PA4: length 8.6
  Top Layer w0.254: H3.9 61.98,78.44 65.13,81.6 R14.2
PA5: length 9.4
  Top Layer w0.254: H3.10 69.8,83.34 R15.2
PA6: length 10.4
  Top Layer w0.254: R16.2 67.21,78.06 H3.11
PA7: length 12.6
  Top Layer w0.254: H3.12 69.6,78.19 74.17,82.76 76.58,82.76 R17.2
PA9: length 51.1
  Top Layer w0.254: UART.2 32.87,96.98 73.53,96.98 H4.6
PA10: length 54.4
  Top Layer w0.3: UART.1 30.88,97.49 74.3,97.49 v1(75.56,96.22)
  Bottom Layer w0.3: H4.7 75.56,94.19 v1(75.56,96.22)
ROW1: length 119.4
  Top Layer w0.254: v1(24.13,62.53) SW5.1 28.29,62.53 28.7,62.95 33.87,62.95 SW5.2 v1(36.07,62.53) ; v1(61.34,62.57) 63.05,62.57 SW13.1 65.24,62.53 65.79,63.08 70.74,63.08 SW13.2 71.28,63.8 v1(69.72,65.36) ; v1(54.74,62.53) SW9.2 52.24,63.08 47.24,63.08 46.7,62.53 SW9.1 v1(42.93,62.53) ; v1(17.65,62.53) SW1.2 15.37,62.95 10.16,62.95 9.74,62.53 SW1.1 ; v1(78.74,65.36) 89.92,65.36 92.84,68.28 92.84,90.38 H4.1
  Bottom Layer w0.254: v1(61.34,62.57) 61.31,62.53 v1(54.74,62.53) ; v1(78.74,65.36) v1(69.72,65.36) ; v1(36.07,62.53) v1(42.93,62.53) ; v1(17.65,62.53) v1(24.13,62.53)
ROW2: length 131.9
  Top Layer w0.254: v1(75.31,46.56) 75.31,63.08 78.36,66.12 89.28,66.12 91.95,68.79 91.95,88.73 H4.2 ; v1(24.38,45) SW6.1 28.29,45 28.83,45.55 33.74,45.55 SW6.2 v1(35.81,45) ; v1(73.28,45.04) 71.32,45.04 SW14.2 70.87,45.42 65.66,45.42 65.24,45 SW14.1 v1(61.34,45) ; v1(54.23,45) SW10.2 52.37,45.42 47.12,45.42 46.7,45 SW10.1 v1(42.67,45) ; v1(17.53,45) SW2.2 15.24,45.55 10.2,45.55 9.65,45 SW2.1
  Bottom Layer w0.254: v1(35.81,45) v1(42.67,45) ; v1(54.23,45) v1(61.34,45) ; v1(73.28,45.04) 73.79,45.04 v1(75.31,46.56) ; v1(17.53,45) v1(24.38,45)
ROW3: length 152.9
  Top Layer w0.254: v1(36.19,27.48) SW7.2 33.74,28.02 27.94,28.02 27.4,27.48 SW7.1 26.05,27.52 v1(24.51,27.52) ; v1(54.48,27.52) 54.45,27.48 SW11.2 52.37,27.9 46.74,27.9 46.32,27.48 SW11.1 44.55,27.52 v1(42.93,27.52) ; v1(17.53,27.52) 17.49,27.48 SW3.2 15.24,28.02 10.03,28.02 9.49,27.48 SW3.1 ; v1(61.59,27.52) 63.05,27.52 SW15.1 64.99,27.48 65.53,28.02 70.74,28.02 SW15.2 71.32,27.52 v1(73.91,27.52) ; v1(74.42,53.55) 74.42,63.84 77.85,67.27 88.65,67.27 91.19,69.81 91.19,86.95 H4.3
  Bottom Layer w0.254: v1(73.91,27.52) 77.85,31.45 77.85,47.71 74.42,51.14 v1(74.42,53.55) ; v1(54.48,27.52) v1(61.59,27.52) ; v1(17.53,27.52) v1(24.51,27.52) ; v1(36.19,27.48) 42.89,27.48 v1(42.93,27.52)
ROW4: length 146.1
  Top Layer w0.254: KEY1.2 93.88,92.77 91.69,94.95 83.95,94.95 H4.4 ; KEY1.2 95.89,60.94 95.89,47.43 KEY2.2 ; KEY1.2 KEY1.1 ; KEY2.2 93.98,45.42 95.89,43.52 95.89,30.03 KEY3.2 ; KEY2.2 KEY2.1 ; KEY3.1 KEY3.2 ; KEY3.2 95.89,25.77 95.89,18.37 91.91,14.4 SW4.2 88.9,14.94 84.07,14.94 83.53,14.4 SW4.1
$1N820: length 6.1
  Top Layer w0.254: SW1.4 13.63,55.88 D2.1
$1N986: length 4.6
  Top Layer w0.254: D6.1 13.63,20.83 SW3.4
$1N1068: length 4
  Top Layer w0.254: D8.1 89.44,6 SW4.4
$1N1150: length 6
  Top Layer w0.254: SW5.4 32.43,56.18 D10.1
$1N1314: length 4.4
  Top Layer w0.254: SW7.4 32.56,21.25 D14.1
$1N1396: length 6.2
  Top Layer w0.254: D16.1 50.46,55.71 SW9.4
$1N1560: length 4.6
  Top Layer w0.254: SW11.4 50.72,20.91 D20.1
$1N1642: length 6
  Top Layer w0.254: SW13.4 69.51,56.26 D22.1
$1N1724: length 5
  Top Layer w0.254: SW14.4 69.51,38.73 D24.1
$1N1806: length 4.4
  Top Layer w0.254: SW15.4 69.64,21.34 D26.1
$1N1847: length 18
  Top Layer w0.254: D27.1 81.38,57.16 KEY1.3 93.88,57.87 93.88,57.86
$1N1888: length 17
  Top Layer w0.254: KEY2.4 KEY2.3 78.8,37.76 D28.1
$1N2696: length 5.6
  Top Layer w0.254: D1.1 8.47,57.15 SW1.3
$1N2698: length 5.7
  Top Layer w0.254: D9.1 27.26,56.85 SW5.3
$1N2700: length 5.7
  Top Layer w0.254: SW9.3 45.8,56.81 D15.1
$1N2702: length 5.7
  Top Layer w0.254: SW13.3 64.22,56.89 64.22,52.79
$1N2704: length 4.7
  Top Layer w0.254: SW14.3 64.22,39.37 64.22,36.28
$1N2706: length 4.2
  Top Layer w0.254: 64.22,19.26 64.22,21.84 SW15.3
$1N2708: length 4.2
  Top Layer w0.254: D19.1 45.8,21.76 SW11.3
$1N2710: length 4.9
  Top Layer w0.254: SW10.3 45.8,39.28 D17.1
$1N2712: length 4.8
  Top Layer w0.254: D11.1 27.26,39.33 SW6.3
$1N2718: length 4.2
  Top Layer w0.254: SW7.3 27.26,21.8 D13.1
$1N2720: length 4.1
  Top Layer w0.254: SW3.3 8.47,22.1 D5.1
$1N2722: length 4
  Top Layer w0.254: D7.1 81.24,9.89 SW4.3
$1N2969: length 4.7
  Top Layer w0.254: SW2.3 8.47,39.62 D3.1
$1N3135: length 5.1
  Top Layer w0.254: D12.1 32.43,38.65 SW6.4
$1N3179: length 5.2
  Top Layer w0.254: SW2.4 13.63,38.35 D4.1
$1N3328: length 5.3
  Top Layer w0.254: D18.1 50.46,38.18 SW10.4
$1N6597: length 17.3
  Top Layer w0.254: D29.1 81.25,22.49 KEY3.3 KEY3.4

## Copper pours and planes (outline as drawn; the poured copper is in the pictures)
GND on Top Layer: -4.19,103.33 103.89,103.33 103.89,-7.28 -4.19,-7.28
GND on Bottom Layer: -4.06,102.57 103.63,102.57 103.63,-2.46 -4.06,-2.46
